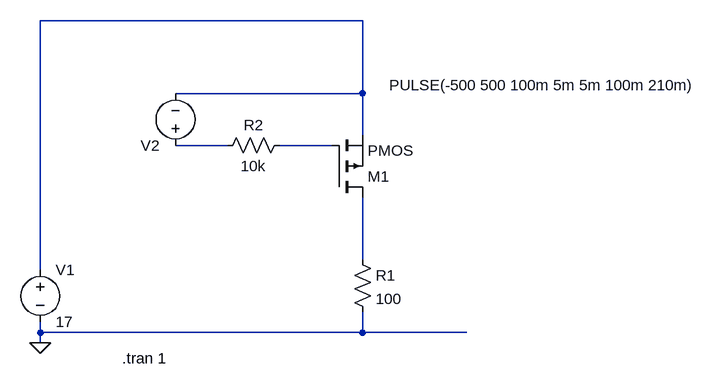
[diagram p0: schematic mosswitchA2.asc]
mosswitchA2.asc, the LTspice schematic file:
Version 4
SHEET 1 888 872
WIRE 368 -208 -128 -208
WIRE 368 -96 368 -208
WIRE 368 -96 80 -96
WIRE 368 -32 368 -96
WIRE 160 -16 80 -16
WIRE 320 -16 240 -16
WIRE 368 160 368 64
WIRE -128 176 -128 -208
WIRE -128 272 -128 256
WIRE 368 272 368 240
WIRE 368 272 -128 272
WIRE 528 272 368 272
WIRE -128 288 -128 272
FLAG -128 288 0
SYMBOL voltage -128 160 R0
WINDOW 123 0 0 Left 0
WINDOW 39 0 0 Left 0
SYMATTR InstName V1
SYMATTR Value 17
SYMBOL voltage 80 0 R180
WINDOW 3 -803 109 Left 2
WINDOW 123 0 0 Left 0
WINDOW 39 0 0 Left 0
SYMATTR InstName V2
SYMATTR Value PULSE(-500 500 100m 5m 5m 100m 210m)
SYMBOL res 256 -32 R90
WINDOW 0 0 56 VBottom 2
WINDOW 3 32 56 VTop 2
SYMATTR InstName R2
SYMATTR Value 10k
SYMBOL res 352 144 R0
SYMATTR InstName R1
SYMATTR Value 100
SYMBOL pmos 320 64 M180
SYMATTR InstName M1
TEXT -2 312 Left 2 !.tran 1

The netlist it stands for:
* mosswitchA2.asc
V1 N001 0 17
V2 N002 N001 PULSE(-500 500 100m 5m 5m 100m 210m)
R2 N003 N002 10k
R1 N004 0 100
M1 N004 N003 N001 N001 PMOS
.model NMOS NMOS
.model PMOS PMOS
.lib standard.mos
.tran 1
.backanno
.end